# Altium schematic sheet Touch_Amplifier.SchDoc
size 420 x 297 mm; SheetNumber: 3; SheetTotal: 3
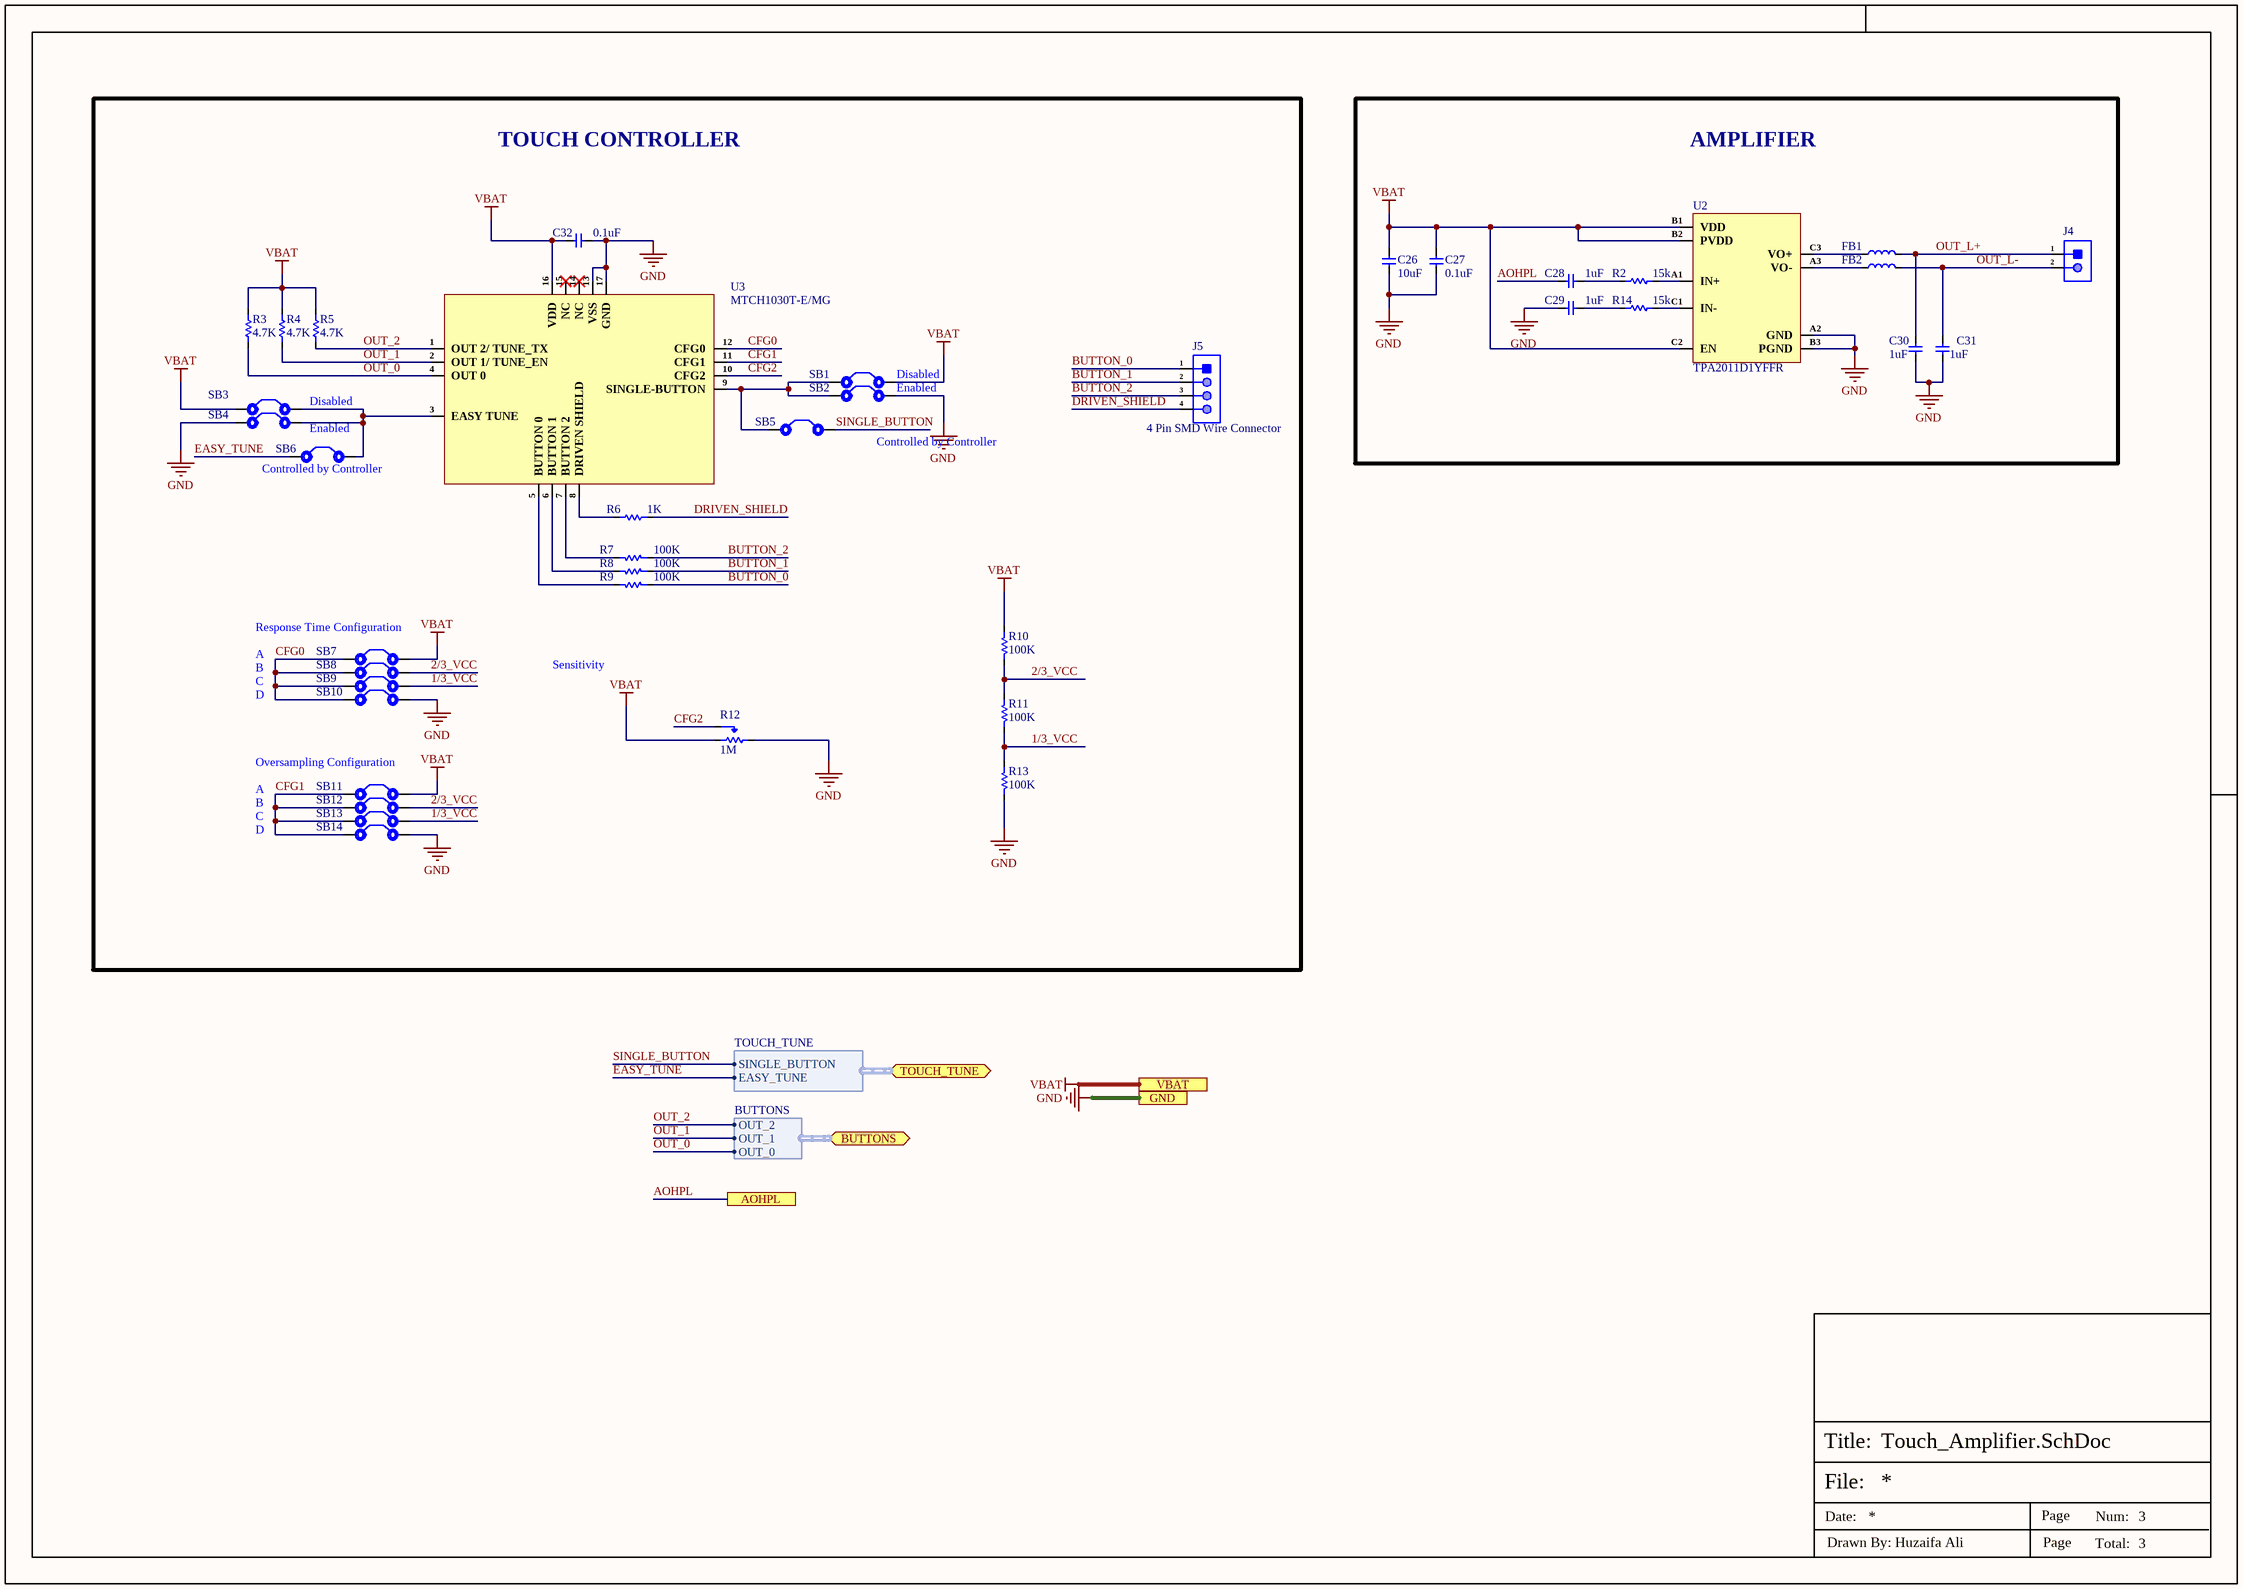
[diagram p0: Touch_Amplifier.SchDoc]

## Parts
C26  10uF  [Cap-0402]
C27  0.1uF  [CAP-0201]
C28  1uF  [Cap-0201]
C29  1uF  [Cap-0201]
C30  1uF  [Cap-0201]
C31  1uF  [Cap-0201]
C32  0.1uF  [CAP-0201]
FB1  MPZ1608S221ATA00  [IND-0603 (1608 Metric)]  (value not drawn)
FB2  MPZ1608S221ATA00  [IND-0603 (1608 Metric)]  (value not drawn)
J4  2 Test Pad  [2 Test Pad]  (value not drawn)
J5  4 Pin SMD Wire Connector  [4 Pin SMD Wire CON.]
R2  15k  [Res-0201]
R3  4.7K  [Res-0201]
R4  4.7K  [Res-0201]
R5  4.7K  [Res-0201]
R6  1K  [Res-0201]
R7  100K  [Res-0201]
R8  100K  [Res-0201]
R9  100K  [Res-0201]
R10  100K  [Res-0201]
R11  100K  [Res-0201]
R12  1M  [TC33X-2-105E]
R13  100K  [Res-0201]
R14  15k  [Res-0201]
SB1  Solder Bridge 0402  [Solder Bridge 0402]  (value not drawn)
SB2  Solder Bridge 0402  [Solder Bridge 0402]  (value not drawn)
SB3  Solder Bridge 0402  [Solder Bridge 0402]  (value not drawn)
SB4  Solder Bridge 0402  [Solder Bridge 0402]  (value not drawn)
SB5  Solder Bridge 0402  [Solder Bridge 0402]  (value not drawn)
SB6  Solder Bridge 0402  [Solder Bridge 0402]  (value not drawn)
SB7  Solder Bridge 0402  [Solder Bridge 0402]  (value not drawn)
SB8  Solder Bridge 0402  [Solder Bridge 0402]  (value not drawn)
SB9  Solder Bridge 0402  [Solder Bridge 0402]  (value not drawn)
SB10  Solder Bridge 0402  [Solder Bridge 0402]  (value not drawn)
SB11  Solder Bridge 0402  [Solder Bridge 0402]  (value not drawn)
SB12  Solder Bridge 0402  [Solder Bridge 0402]  (value not drawn)
SB13  Solder Bridge 0402  [Solder Bridge 0402]  (value not drawn)
SB14  Solder Bridge 0402  [Solder Bridge 0402]  (value not drawn)
U2  TPA2011D1YFFR  [9-DSBGA]
U3  MTCH1030T-E/MG  [16-QFN (3x3).]

## Blocks framed on the sheet
TOUCH CONTROLLER: C32 J5 R3-R13 SB1-SB14 U3
AMPLIFIER: C26-C31 FB1 FB2 J4 R2 R14 U2

## Ports
AOHPL, BUTTONS (bidir, harness BUTTONS), GND, TOUCH_TUNE (bidir, harness TOUCH_TUNE), VBAT

## Harnesses
BUTTONS: OUT_2, OUT_1, OUT_0
TOUCH_TUNE: SINGLE_BUTTON, EASY_TUNE

## Nets
GND: C26.1 C27.1 C29.1 C30.1 C31.1 C32.2 R12.3(CW) R13.2 SB2.1 SB4.1 SB10.2 SB14.2 U2.A2(GND) U2.B3(PGND) U3.13(VSS) U3.17(GND) ; port GND
VBAT: C26.2 C27.2 C32.1 R3.2 R4.2 R5.2 R10.1 R12.1(CCW) SB1.1 SB3.1 SB7.2 SB11.2 U2.B1(VDD) U2.B2(PVDD) U2.C2(EN) U3.16(VDD) ; port VBAT
1/3_VCC: R11.2 R13.1 SB9.2 SB13.2
2/3_VCC: R10.2 R11.1 SB8.2 SB12.2
AOHPL: C28.1 ; port AOHPL
BUTTON_0: J5.1 R9.1
BUTTON_1: J5.2 R8.1
BUTTON_2: J5.3 R7.1
CFG0: SB7.1 SB8.1 SB9.1 SB10.1 U3.12(CFG0)
CFG1: SB11.1 SB12.1 SB13.1 SB14.1 U3.11(CFG1)
CFG2: R12.2(Wiper) U3.10(CFG2)
DRIVEN_SHIELD: J5.4 R6.2
EASY_TUNE: SB6.1 ; port TOUCH_TUNE.EASY_TUNE
OUT_0: R3.1 U3.4(OUT_0) ; port BUTTONS.OUT_0
OUT_1: R4.1 U3.2(OUT_1/_TUNE_EN) ; port BUTTONS.OUT_1
OUT_2: R5.1 U3.1(OUT_2/_TUNE_TX) ; port BUTTONS.OUT_2
OUT_L+: C30.2 FB1.2 J4.1
OUT_L-: C31.2 FB2.2 J4.2
SINGLE_BUTTON: SB5.1 ; port TOUCH_TUNE.SINGLE_BUTTON
NetC28_2: C28.2 R2.1
NetC29_2: C29.2 R14.1
NetFB1_1: FB1.1 U2.C3(VO+)
NetFB2_1: FB2.1 U2.A3(VO-)
NetR2_2: R2.2 U2.A1(IN+)
NetR6_1: R6.1 U3.8(DRIVEN_SHIELD)
NetR7_2: R7.2 U3.7(BUTTON_2)
NetR8_2: R8.2 U3.6(BUTTON_1)
NetR9_2: R9.2 U3.5(BUTTON_0)
NetR14_2: R14.2 U2.C1(IN-)
NetSB1_2: SB1.2 SB2.2 SB5.2 U3.9(SINGLE-BUTTON)
NetSB3_2: SB3.2 SB4.2 SB6.2 U3.3(EASY_TUNE)

Not connected (* = marked no-connect by the designer): U3 14(NC)* 15(NC)*

## Notes on the sheet
- Enabled
- Disabled
- (near SB5) Controlled by Controller
- (near SB6) Controlled by Controller
- Text
- Sensitivity
- Response Time Configuration
  A
  B
  C
  D
- Oversampling Configuration
  A
  B
  C
  D
- File:
- Title:
- Date:
- Page
- Num:
- Total:
- Drawn By: Huzaifa Ali

## Library data of the parts
C26 = CL05A106MP5NUNC: CAP CER 10UF 10V X5R 0402; Manufacturer: Samsung; Tolerance: 20%; Item Type: Capacitor; Supplier 1: Avnet; Manufacturer Part Number: CL05A106MP5NUNC; RoHS: Yes; Category: Ceramic Capacitors; Stock 1: 1729850; Pricing 1: 10000=0.02537 (USD); Mount: Surface Mount; Case/Package: 0402; Case Code (Metric): 1005; Case Code (Imperial): 0402; Contact Plating: Tin; Min Operating Temperature: -55°C; Max Operating Temperature: 85°C; Package Quantity: 1; Packaging: Tape and Reel; Capacitance: 10uF; Voltage Rating: 10V; Dielectric: X5R; Termination: Wraparound; Series: CL; Construction: Flat; Length: 1mm; Width: 0.02inch; Thickness: 0.028inch; Depth: 0.5mm; Radiation Hardening: No; Lead Free: Lead Free; RoHS Compliant: Yes; ComponentLink1URL: https://datasheet.ciiva.com/25721/cl05a106mp5nunc-25721584.pdf?src-supplier=Digi-Key; ComponentLink1Description: https://datasheet.ciiva.com/25721/cl05a106mp5nunc-25721584.pdf?src-supplier=Digi-Key; ComponentLink2URL: https://datasheet.ciiva.com/26838/getdatasheetpartid-745310-26838170.pdf?src-supplier=Verical; ComponentLink2Description: https://datasheet.ciiva.com/26838/getdatasheetpartid-745310-26838170.pdf?src-supplier=Verical; Supplier Part Number 1: CL05A106MP5NUNC; LCSC Part Number: C315248
C27 C32 = CC0201KRX5R6BB104: CAP CER 0.1UF 10V X5R 0201; Manufacturer: Yageo; Capacitance: 100nF; Tolerance: 10%; Supplier 1: Mouser; Manufacturer Part Number: CC0201KRX5R6BB104; RoHS: Yes; Category: Ceramic Capacitors; Stock 1: 824403; Pricing 1: 1=0.10000, 10=0.02400, 50=0.02400, 100=0.01900, 1000=0.01100, 10000=0.00900 (USD); Mount: Surface Mount; Case/Package: 0201; Case Code (Imperial): 0201; Case Code (Metric): 0603; Weight: 6E-06oz; Min Operating Temperature: -55°C; Max Operating Temperature: 85°C; Dielectric: X5R; Voltage Rating (DC): 10V; Packaging: Tape and Reel; Termination: SMD/SMT; Resistor Type: Ceramic; Voltage Rating: 10V; Series: CC; Construction: Flat; Length: 0.6mm; Width: 0.012inch; Height: 0.3mm; Thickness: 0.013inch; Depth: 0.3mm; Radiation Hardening: No; Lead Free: Lead Free; Halogen Free: Halogen Free; RoHS Compliant: Yes; ComponentLink1URL: https://datasheet.ciiva.com/11587/upy-gphc-x5r-4v-to-50v-12-11587190.pdf?src-supplier=Avnet; ComponentLink1Description: https://datasheet.ciiva.com/11587/upy-gphc-x5r-4v-to-50v-12-11587190.pdf?src-supplier=Avnet; Supplier Part Number 1: 603-CC201KRX5R6BB104; LCSC Part Number: C190183
C28-C31 = CC0201KRX5R5BB105: CAP CER 1UF 6.3V X5R 0201; Manufacturer: Yageo; Tolerance: 10%; Item Type: Capacitor; Supplier 1: Arrow Electronics; Manufacturer Part Number: CC0201KRX5R5BB105; RoHS: Yes; Category: Ceramic Capacitors; Stock 1: 600000; Pricing 1: 15000=0.00740 (USD); Mount: Surface Mount; Case/Package: 0201; Case Code (Imperial): 0201; Case Code (Metric): 0603; Min Operating Temperature: -55°C; Max Operating Temperature: 85°C; Packaging: Cut Tape; Capacitance: 1uF; Voltage Rating: 6.3V; RoHS Compliant: Yes; ComponentLink1URL: http://www.yageo.com/documents/recent/UPY-GPHC_X5R_4V-to-50V_25.pdf?src-supplier=Digi-Key; ComponentLink1Description: http://www.yageo.com/documents/recent/UPY-GPHC_X5R_4V-to-50V_25.pdf?src-supplier=Digi-Key; ComponentLink2URL: https://www.yageo.com/upload/media/product/productsearch/datasheet/mlcc/UPY-GPHC_X5R_4V-to-50V_26.pdf?src-supplier=Digi-Key; ComponentLink2Description: https://www.yageo.com/upload/media/product/productsearch/datasheet/mlcc/UPY-GPHC_X5R_4V-to-50V_26.pdf?src-supplier=Digi-Key; Supplier Part Number 1: CC0201KRX5R5BB105; LCSC Part Number: C541330
FB1 FB2 = MPZ1608S221ATA00: FERRITE BEAD 220 OHM 0603 1LN; Manufacturer: TDK; Current Rating: 2.2A; Tolerance: 25%; Impedance: 220R; DC Resistance (DCR): 50mR; Test Frequency: 100MHz; Number of Lines: 1; Supplier: Avnet; Supplier Part Number: MPZ1608S221ATA00; Manufacturer Part Number: MPZ1608S221ATA00; RoHS: Yes; Category: Ferrite Beads and Chips; Stock: 4000; Pricing: 4000=0.02405, 8000=0.02275, 16000=0.02145, 24000=0.01953, 32000=0.01827 (USD); Mounting Technology: Surface Mount; Case/Package: 0603; Pins: 2; Case Code (Imperial): 0603; Core Material: Ferrite; Case Code (Metric): 1608; Packaging: Cut Tape; Package Quantity: 1; Max DC Current: 2.2A; Series: MPZ; Max Current Rating: 2.2A; RMS Current (Irms): 2.2A; ESR: 50mR; Length: 0.063inch; Width: 0.031inch; Height: 0.037inch; Lead Free: Lead Free; RoHS Compliant: Yes; Reach SVHC Compliant: No; ComponentLink1URL: https://datasheet.ciiva.com/8077/55167-8077073.pdf?src-supplier=Element14; ComponentLink1Description: https://datasheet.ciiva.com/8077/55167-8077073.pdf?src-supplier=Element14; ComponentLink2URL: https://datasheet.ciiva.com/8077/55167-8077071.pdf?src-supplier=Element14; ComponentLink2Description: https://datasheet.ciiva.com/8077/55167-8077071.pdf?src-supplier=Element14; ComponentLink3URL: https://datasheet.ciiva.com/46381/1486324-46381628.pdf?src-supplier=Element14; ComponentLink3Description: https://datasheet.ciiva.com/46381/1486324-46381628.pdf?src-supplier=Element14; ComponentLink4URL: https://datasheet.ciiva.com/46366/print-detail-pdf-phplangenpart-nompz1608s221ata00nreimp-unit-xmhz-46366044.pdf?src-supplier=Onlinecomponents.com; ComponentLink4Description: https://datasheet.ciiva.com/46366/print-detail-pdf-phplangenpart-nompz1608s221ata00nreimp-unit-xmhz-46366044.pdf?src-supplier=Onlinecomponents.com; LCSC Part Number: C76815; Item Type: Ferrite Bead
J4 = 2 Test Pad: Wire Connecting Pad; Item Type: Test Point; Manufacturer Part Number: 2 Test Pad
J5 = 4 Pin SMD Wire Connector: Wire Connecting Pads; Item Type: SMD Pads; Manufacturer Part Number: 4 Pin SMD Wire Connector
R2 R14 = RC0201FR-0715KL: RES 15K OHM 1% 1/20W 0201; Manufacturer: Yageo; Voltage Rating (DC): 25V; Item Type: Resistor; Supplier 1: Future Electronics; Manufacturer Part Number: RC0201FR-0715KL; RoHS: Yes; Category: Chip SMD Resistors; Stock 1: 360000; Pricing 1: 10000=0.0035, 50000=0.0033, 250000=0.0031, 750000=0.003, 2000000=0.0028 (USD); Lead Free: 5697LeadFree; ComponentLink1URL: https://datasheet.ciiva.com/6002/1563626-6002808.pdf?src-supplier=Farnell; ComponentLink1Description: https://datasheet.ciiva.com/6002/1563626-6002808.pdf?src-supplier=Farnell; ComponentLink2URL: https://datasheet.ciiva.com/22661/1563626-22661288.pdf?src-supplier=Element14; ComponentLink2Description: https://datasheet.ciiva.com/22661/1563626-22661288.pdf?src-supplier=Element14; Supplier Part Number 1: 9770686; LCSC Part Number: C295774
R3-R5 = RC0201FR-074K7L: RES 4.7K OHM 1% 1/20W 0201; Manufacturer: Yageo; Item Type: Resistor; Supplier: Future Electronics; Supplier Part Number: 7537285; Manufacturer Part Number: RC0201FR-074K7L; RoHS: Yes; Category: Chip SMD Resistors; Stock: 1610000; Pricing: 10000=0.0014, 50000=0.0013, 250000=0.0013, 750000=0.0012, 2000000=0.0011 (USD); ComponentLink1URL: https://datasheet.ciiva.com/2493/pyu-r-int-thick-7-2493811.pdf?src-supplier=Digi-Key; ComponentLink1Description: https://datasheet.ciiva.com/2493/pyu-r-int-thick-7-2493811.pdf?src-supplier=Digi-Key; ComponentLink2URL: https://datasheet.ciiva.com/2493/pyu-r-int-thick-7-2493812.pdf?src-supplier=Digi-Key; ComponentLink2Description: https://datasheet.ciiva.com/2493/pyu-r-int-thick-7-2493812.pdf?src-supplier=Digi-Key; ComponentLink3URL: https://datasheet.ciiva.com/2493/pyu-r-int-thick-7-2493813.pdf?src-supplier=Digi-Key; ComponentLink3Description: https://datasheet.ciiva.com/2493/pyu-r-int-thick-7-2493813.pdf?src-supplier=Digi-Key; ComponentLink4URL: https://datasheet.ciiva.com/8892/pyu-rc0201-51-rohs-l-8-8892942.pdf?src-supplier=Avnet; ComponentLink4Description: https://datasheet.ciiva.com/8892/pyu-rc0201-51-rohs-l-8-8892942.pdf?src-supplier=Avnet; ComponentLink5URL: https://datasheet.ciiva.com/7672/1563626-7672233.pdf?src-supplier=Element14; ComponentLink5Description: https://datasheet.ciiva.com/7672/1563626-7672233.pdf?src-supplier=Element14; LCSC Part Number: C138135
R6 = RC0201FR-071KP: RES 1K OHM 1% 1/20W 0201; Manufacturer: Yageo; Supplier 1: Digi-Key; Manufacturer Part Number: RC0201FR-071KP; RoHS: Yes; Stock 1: 4800; Pricing 1: 1=0.11000, 10=0.10200, 100=0.03940, 1000=0.01734, 2500=0.01497, 5000=0.01340 (USD); RoHS Compliant: Yes; Supplier Part Number 1: 13-RC0201FR-071KPCT-ND; LCSC Part Number: C3953443
R7-R11 R13 = RC0201FR-07100KL: RES 100K OHM 1% 1/20W 0201; Manufacturer: Yageo; Resistance: 100kR; Temperature Coefficient: 200ppm/°C; Power Rating: 50mW; Voltage Rating: 25V; Supplier 1: Digi-Key; Manufacturer Part Number: RC0201FR-07100KL; RoHS: Yes; Category: Chip SMD Resistors; Stock 1: 6740592; Pricing 1: 1=0.10000, 10=0.03900, 100=0.01570, 1000=0.00705, 2500=0.00612, 5000=0.00506 (USD); Case/Package: 0201; Number of Pins: 2; Contact Plating: Tin,Matte; Case Code (Imperial): 0201; Case Code (Metric): 0603; Size Code: 0201; Min Operating Temperature: -55°C; Max Operating Temperature: 125°C; Tolerance: 1%; Resistor Type: Thick Film; Packaging: Tape and Reel; Package Quantity: 10000; Termination: SMD/SMT; Number of Terminations: 2; Max Power Dissipation: 50mW; Voltage Rating (DC): 25V; Features: Moisture Resistant; Series: RC; Resistance Tolerance: 1%; Construction: Rectangular; Length: 0.024inch; Width: 0.012inch; Height: 0.01inch; Depth: 0.3mm; REACH SVHC: No SVHC; Military Standard: Not; Lead Free: Lead Free; RoHS Compliant: Yes; ComponentLink1URL: https://datasheet.ciiva.com/7660/1421516-7660806.pdf?src-supplier=Element14; ComponentLink1Description: https://datasheet.ciiva.com/7660/1421516-7660806.pdf?src-supplier=Element14; ComponentLink2URL: https://datasheet.ciiva.com/22698/1563626-22698495.pdf?src-supplier=Element14; ComponentLink2Description: https://datasheet.ciiva.com/22698/1563626-22698495.pdf?src-supplier=Element14; ComponentLink3URL: https://datasheet.ciiva.com/46391/1421516-46391338.pdf?src-supplier=Element14; ComponentLink3Description: https://datasheet.ciiva.com/46391/1421516-46391338.pdf?src-supplier=Element14; ComponentLink4URL: https://datasheet.ciiva.com/2493/pyu-r-int-thick-7-2493770.pdf?src-supplier=Digi-Key; ComponentLink4Description: https://datasheet.ciiva.com/2493/pyu-r-int-thick-7-2493770.pdf?src-supplier=Digi-Key; ComponentLink5URL: https://datasheet.ciiva.com/2493/pyu-r-int-thick-7-2493771.pdf?src-supplier=Digi-Key; ComponentLink5Description: https://datasheet.ciiva.com/2493/pyu-r-int-thick-7-2493771.pdf?src-supplier=Digi-Key; ComponentLink6URL: https://datasheet.ciiva.com/2493/pyu-r-int-thick-7-2493769.pdf?src-supplier=Digi-Key; ComponentLink6Description: https://datasheet.ciiva.com/2493/pyu-r-int-thick-7-2493769.pdf?src-supplier=Digi-Key; ComponentLink7URL: https://datasheet.ciiva.com/26829/getdatasheetpartid-420441-26829850.pdf?src-supplier=Verical; ComponentLink7Description: https://datasheet.ciiva.com/26829/getdatasheetpartid-420441-26829850.pdf?src-supplier=Verical; Supplier Part Number 1: 311-100KMCT-ND
R12 = TC33X-2-105E: TRIMMER 1M OHM 0.1W J LEAD TOP; Manufacturer: Bourns; Item Type: Variable Resistor; Supplier: Arrow Electronics; Supplier Part Number: TC33X-2-105E; Manufacturer Part Number: TC33X-2-105E; RoHS: Yes; Category: Variable Resistors and Potentiometers; Stock: 5461; Pricing: 1=0.2738, 10=0.235, 25=0.2264, 100=0.2108, 250=0.2012, 500=0.1814, 1000=0.1356, 3000=0.126 (USD); ComponentLink1URL: https://datasheet.ciiva.com/6227/tc33-6227126.pdf?src-supplier=Digi-Key; ComponentLink1Description: https://datasheet.ciiva.com/6227/tc33-6227126.pdf?src-supplier=Digi-Key; ComponentLink2URL: https://datasheet.ciiva.com/43453/306tc33-43453797.pdf?src-supplier=Onlinecomponents.com; ComponentLink2Description: https://datasheet.ciiva.com/43453/306tc33-43453797.pdf?src-supplier=Onlinecomponents.com; LCSC Part Number: C5362465
SB1-SB14 = Solder Bridge 0402: Solder Bridge ON; Manufacturer Part Number: Solder Bridge 0402; Item Type: Solder Bridge
U2 = TPA2011D1YFFR: IC AMP AUDIO PWR 3.2W D 9DSBGA; Manufacturer: Texas Instruments; Max Power Dissipation: 525mW; Max Supply Voltage: 5.5V; Min Supply Voltage: 2.5V; Max Output Power: 3.24W; Number of Channels: 1; Power Supply Rejection Ratio (PSRR): 86dB; Quiescent Current: 1.8mA; Supply Current: 1.5mA; Supplier 1: Mouser; Manufacturer Part Number: TPA2011D1YFFR; RoHS: Yes; Category: Amplifiers - Audio; Stock 1: 6964; Pricing 1: 1=0.83, 10=0.698, 50=0.698, 100=0.529, 1000=0.353, 10000=0.293 (USD); Case/Package: BGA; Number of Pins: 9; Min Operating Temperature: -40°C; Max Operating Temperature: 85°C; Output Power: 3.2W; Series: -; Packaging: Tape and Reel; Package Quantity: 3000; Power Dissipation: 525mW; Radiation Hardening: No; Lead Free: Lead Free; RoHS Compliant: Yes; ComponentLink1URL: https://datasheet.ciiva.com/1789/tpa2011d1-1789073.pdf?src-supplier=Digi-Key; ComponentLink1Description: https://datasheet.ciiva.com/1789/tpa2011d1-1789073.pdf?src-supplier=Digi-Key; ComponentLink2URL: https://datasheet.ciiva.com/1789/tpa2011d1-1789074.pdf?src-supplier=Digi-Key; ComponentLink2Description: https://datasheet.ciiva.com/1789/tpa2011d1-1789074.pdf?src-supplier=Digi-Key; ComponentLink3URL: https://datasheet.ciiva.com/1789/tpa2011d1-1789075.pdf?src-supplier=Digi-Key; ComponentLink3Description: https://datasheet.ciiva.com/1789/tpa2011d1-1789075.pdf?src-supplier=Digi-Key; ComponentLink4URL: https://datasheet.ciiva.com/15223/getdatasheetpartid-306371-15223959.pdf?src-supplier=Verical; ComponentLink4Description: https://datasheet.ciiva.com/15223/getdatasheetpartid-306371-15223959.pdf?src-supplier=Verical; Supplier Part Number 1: 595-TPA2011D1YFFR; LCSC Part Number: C468251; Item Type: IC
U3 = MTCH1030T-E/MG: 3 CHANNEL TOUCH CONTROLLER, GPIO; Manufacturer: Microchip; Item Type: IC; Supplier: Digi-Key; Supplier Part Number: 150-MTCH1030T-E/MGCT-ND; Manufacturer Part Number: MTCH1030T-E/MG; RoHS: No; Stock: 3300; Pricing: 1=1, 25=0.92, 100=0.83 (USD)